# Altium schematic sheet Revision history.SchDoc
size Letter; SheetNumber: 6; SheetTotal: 7
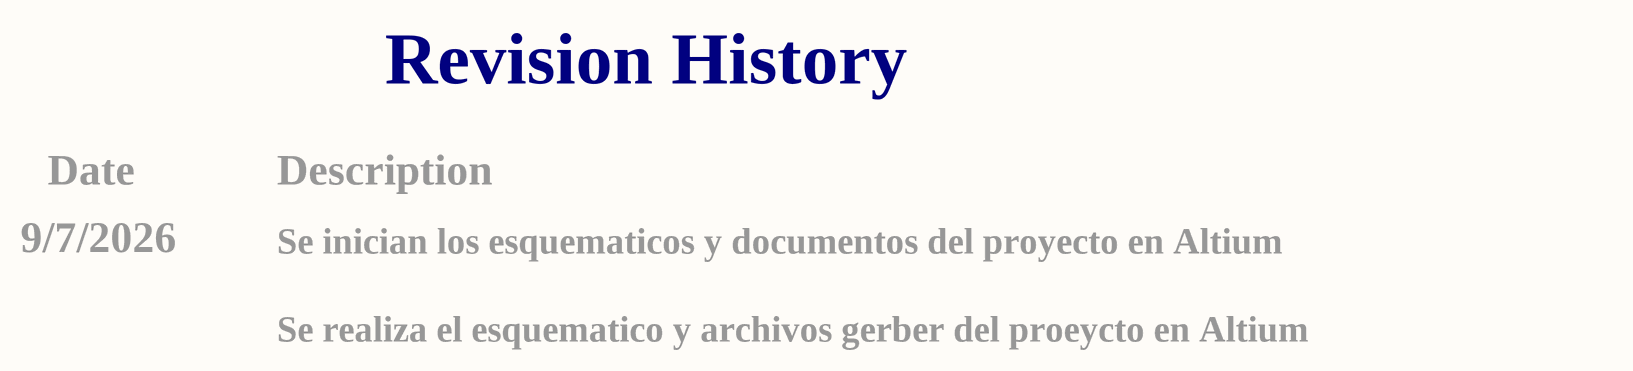
[diagram p0: Revision history.SchDoc]

## Notes on the sheet
- Revision History
- Date
- Description
- 9/7/2026
- Se inician los esquematicos y documentos del proyecto en Altium
- Se realiza el esquematico y archivos gerber del proeycto en Altium
- Proyecto:
- Autor:
- Carné:
- Documento:
- Curso:
- Revision:
- Fecha:
- Tamaño:
- Carta
- Hoja:      de